# Altium schematic sheet 1_Power.SchDoc
size 419 x 256 mm; SheetNumber: 3; SheetTotal: 4
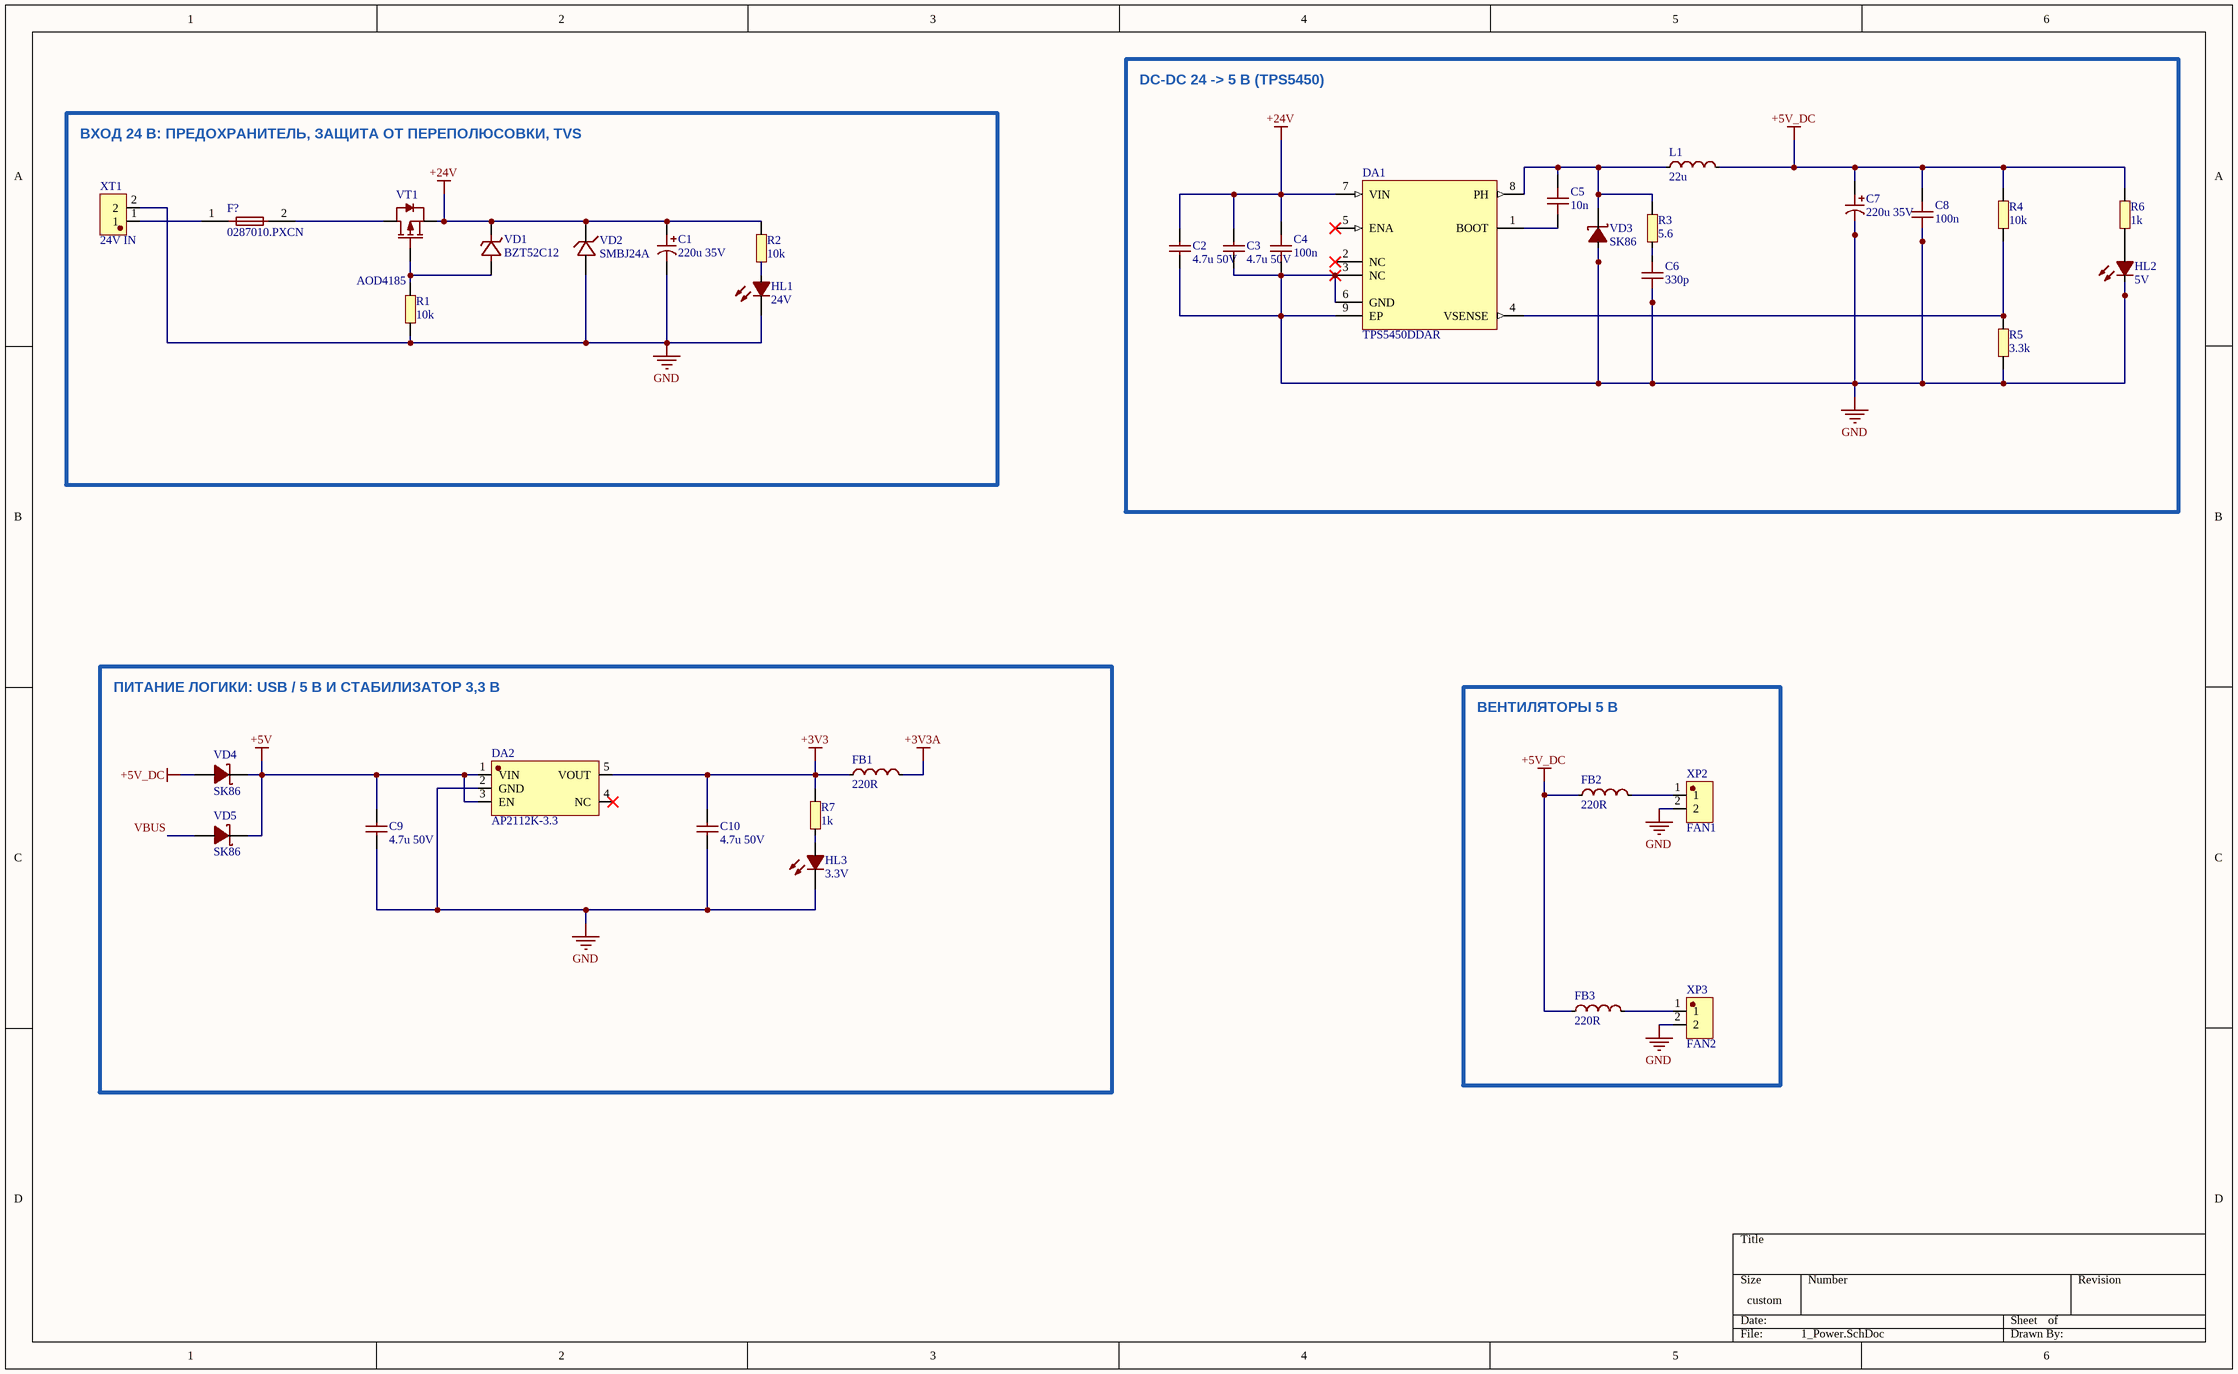
[diagram p0: 1_Power.SchDoc]

## Parts
C1  220u 35V  [CAP-TH_BD8.0-P3.50-D0.5-FD]
C2  4.7u 50V  [C1206]
C3  4.7u 50V  [C1206]
C4  100n  [C0603]
C5  10n  [C0603]
C6  330p  [C0603]
C7  220u 35V  [CAP-TH_BD8.0-P3.50-D0.5-FD]
C8  100n  [C0603]
C9  4.7u 50V  [C1206]
C10  4.7u 50V  [C1206]
DA1  TPS5450DDAR  [SOP-8_L4.9-W3.9-P1.27-LS6.0-BL-EP]
DA2  AP2112K-3.3  [SOT-25-5_L2.9-W1.6-P0.95-LS2.8-BL]
F?  0287010.PXCN  [FUSE-TH_L19.1-W5.1]
FB1  220R  [L0805]
FB2  220R  [L0805]
FB3  220R  [L0805]
HL1  24V  [LED0603-RD_GREEN]
HL2  5V  [LED0603-RD_GREEN]
HL3  3.3V  [LED0603-RD_GREEN]
L1  22u  [IND-SMD_L8.0-W8.0]
R1  10k  [R0603]
R2  10k  [R0603]
R3  5.6  [R0603]
R4  10k  [R0603]
R5  3.3k  [R0603]
R6  1k  [R0603]
R7  1k  [R0603]
VD1  BZT52C12  [SOD-123_L2.7-W1.6-LS3.7-RD-1]
VD2  SMBJ24A  [SMB_L4.3-W3.6-LS5.4-RD]
VD3  SK86  [SMC_L7.1-W6.2-LS8.1-R-RD]
VD4  SK86  [SMC_L7.1-W6.2-LS8.1-R-RD]
VD5  SK86  [SMC_L7.1-W6.2-LS8.1-R-RD]
VT1  AOD4185  [TO-252-3_L6.5-W5.8-P4.58-BL]
XP2  FAN1  [HDR-TH_2P-P2.54-V-M]
XP3  FAN2  [HDR-TH_2P-P2.54-V-M]
XT1  24V IN  [CONN-TH_P3.50_KF350-3.5-2P]

## Blocks framed on the sheet
DC-DC 24 -> 5 В (TPS5450): C2-C8 DA1 HL2 L1 R3-R6 VD3
ВХОД 24 В: ПРЕДОХРАНИТЕЛЬ, ЗАЩИТА ОТ ПЕРЕПОЛЮСОВКИ, TVS: C1 F? HL1 R1 R2 VD1 VD2 VT1 XT1
ПИТАНИЕ ЛОГИКИ: USB / 5 В И СТАБИЛИЗАТОР 3,3 В: C9 C10 DA2 FB1 HL3 R7 VD4 VD5
ВЕНТИЛЯТОРЫ 5 В: FB2 FB3 XP2 XP3

## Nets
+3V3: C10.1 DA2.5(VOUT) FB1.1 R7.1
+3V3A: FB1.2
+5V: C9.1 DA2.1(VIN) DA2.3(EN) VD4.2(K) VD5.2(K)
+5V_DC: C7.1 C8.1 FB2.1 FB3.1 L1.2 R4.1 R6.1 VD4.1(A)
+24V: C1.1 C2.1 C3.1 C4.1 DA1.7(VIN) R2.1 VD1.1(C) VD2.1 VT1.3(S)
GND: C1.2 C2.2 C3.2 C4.2 C6.2 C7.2 C8.2 C9.2 C10.2 DA1.3(NC) DA1.6(GND) DA1.9(EP) DA2.2(GND) HL1.1(C) HL2.1(C) HL3.1(C) R1.2 R5.2 VD2.2 VD3.1(A) XP2.2 XP3.2 XT1.2
VBUS: VD5.1(A)
NetC5_1: C5.1 DA1.8(PH) L1.1 R3.1 VD3.2(K)
NetC5_2: C5.2 DA1.1(BOOT)
NetC6_1: C6.1 R3.2
NetDA1_4: DA1.4(VSENSE) R4.2 R5.1
NetF?_1: F?.1 XT1.1
NetF?_2: F?.2 VT1.2(D)
NetFB2_2: FB2.2 XP2.1
NetFB3_2: FB3.2 XP3.1
NetHL1_2: HL1.2(A) R2.2
NetHL2_2: HL2.2(A) R6.2
NetHL3_2: HL3.2(A) R7.2
NetR1_1: R1.1 VD1.2(A) VT1.1(G)

Not connected (* = marked no-connect by the designer): DA1 2(NC)* 5(ENA)*; DA2 4(NC)*

## Library data of the parts
C1 C7 = 220UF35V8X12KM: Manufacturer: Econd; Value: 220uF; Manufacturer Part Number: 220uF35V8x12KM; LCSC Part: C49304872; Supplier: LCSC; Supplier Part Number: C49304872; JLCPCB Part Class: Extended Part; Datasheet: https://www.lcsc.com/datasheet/C49304872.pdf; Source: JLCEDA/EasyEDA Official Library (https://easyeda.com, https://lceda.cn)
C2 C3 C9 C10 = CL31B475KBHNNNE: 4.7uF (475) ±10% 50V; Manufacturer: SAMSUNG; Value: 4.7uF; Manufacturer Part Number: CL31B475KBHNNNE; LCSC Part: C51205; Supplier: LCSC; Supplier Part Number: C51205; JLCPCB Part Class: Extended Part; Datasheet: https://www.lcsc.com/datasheet/C51205.pdf; LCSC URL: https://lcsc.com/product-detail/Multilayer-Ceramic-Capacitors-MLCC-SMD-SMT_SAMSUNG_CL31B475KBHNNNE_4-7uF-475-10-50V_C51205.html; Source: JLCEDA/EasyEDA Official Library (https://easyeda.com, https://lceda.cn)
C4-C6 C8 = CL10B104KB8NNNC/0603: Manufacturer Part Number: CL10B104KB8NNNC/0603; LCSC Part: C9900007620; Supplier: LCSC; Supplier Part Number: C9900007620; Datasheet: https://www.lcsc.com/datasheet/C9900007620.pdf; Source: JLCEDA/EasyEDA Official Library (https://easyeda.com, https://lceda.cn)
DA1 = TPS5450DDAR: Manufacturer: TI; Manufacturer Part Number: TPS5450DDAR; LCSC Part: C114425; Supplier: LCSC; Supplier Part Number: C114425; JLCPCB Part Class: Extended Part; Datasheet: https://www.lcsc.com/datasheet/C114425.pdf; LCSC URL: https://lcsc.com/product-detail/DC-DC-Converters_TI_TPS5450DDAR_TPS5450DDAR_C114425.html; Source: JLCEDA/EasyEDA Official Library (https://easyeda.com, https://lceda.cn)
DA2 = AP2112K-3.3TRG1: Manufacturer: DIODES; Manufacturer Part Number: AP2112K-3.3TRG1; LCSC Part: C51118; Supplier: LCSC; Supplier Part Number: C51118; JLCPCB Part Class: Extended Part; Datasheet: https://www.lcsc.com/datasheet/C51118.pdf; LCSC URL: https://lcsc.com/product-detail/Low-Dropout-Regulators-LDO_DIODES_AP2112K-3-3TRG1_AP2112K-3-3TRG1_C51118.html; Source: JLCEDA/EasyEDA Official Library (https://easyeda.com, https://lceda.cn)
F? = 0287010.PXCN: Manufacturer: Littelfuse; Manufacturer Part Number: 0287010.PXCN; LCSC Part: C142683; Supplier: LCSC; Supplier Part Number: C142683; JLCPCB Part Class: Extended Part; Datasheet: https://www.lcsc.com/datasheet/C142683.pdf; Source: JLCEDA/EasyEDA Official Library (https://easyeda.com, https://lceda.cn)
FB1-FB3 = BLM21PG221SN1D: 220Ohm ±25% @100MHz 2A; Manufacturer: muRata; Value: 220Ω; Manufacturer Part Number: BLM21PG221SN1D; LCSC Part: C85840; Supplier: LCSC; Supplier Part Number: C85840; JLCPCB Part Class: Extended Part; Datasheet: https://www.lcsc.com/datasheet/C85840.pdf; LCSC URL: https://lcsc.com/product-detail/Ferrite-Beads-And-Chips_muRata_BLM21PG221SN1D_220R-25-at100MHz-2A_C85840.html; Source: JLCEDA/EasyEDA Official Library (https://easyeda.com, https://lceda.cn)
HL1-HL3 = KT-0603GH: Manufacturer Part Number: KT-0603GH; LCSC Part: C9900005170; Supplier: LCSC; Supplier Part Number: C9900005170; JLCPCB Part Class: Extended Part; Datasheet: https://www.lcsc.com/datasheet/C9900005170.pdf; Source: JLCEDA/EasyEDA Official Library (https://easyeda.com, https://lceda.cn)
L1 = SWPA8040S220MT: 22uH ±20%; Manufacturer: Sunlord; Value: 22uH; Manufacturer Part Number: SWPA8040S220MT; LCSC Part: C15857; Supplier: LCSC; Supplier Part Number: C15857; JLCPCB Part Class: Extended Part; Datasheet: https://www.lcsc.com/datasheet/C15857.pdf; LCSC URL: https://lcsc.com/product-detail/Power-Inductors_22uH-20_C15857.html; Source: JLCEDA/EasyEDA Official Library (https://easyeda.com, https://lceda.cn)
R1-R7 = 0603WAF1002T5E: 10KOhm (1002) ±1%; Manufacturer: UNI-ROYAL; Value: 10kΩ; Manufacturer Part Number: 0603WAF1002T5E; LCSC Part: C25804; Supplier: LCSC; Supplier Part Number: C25804; JLCPCB Part Class: Basic Part; Datasheet: https://www.lcsc.com/datasheet/C25804.pdf; LCSC URL: https://lcsc.com/product-detail/Chip-Resistor-Surface-Mount-UniOhm_10KR-1002-1_C25804.html; Source: JLCEDA/EasyEDA Official Library (https://easyeda.com, https://lceda.cn)
VD1 = BZT52C12V: Manufacturer: JUXING; Manufacturer Part Number: BZT52C12V; LCSC Part: C5182293; Supplier: LCSC; Supplier Part Number: C5182293; JLCPCB Part Class: Extended Part; Datasheet: https://www.lcsc.com/datasheet/C5182293.pdf; Source: JLCEDA/EasyEDA Official Library (https://easyeda.com, https://lceda.cn)
VD2 = SMBJ24A_C224017: Manufacturer: Littelfuse; Manufacturer Part Number: SMBJ24A; LCSC Part: C224017; Supplier: LCSC; Supplier Part Number: C224017; JLCPCB Part Class: Extended Part; Datasheet: https://www.lcsc.com/datasheet/C224017.pdf; LCSC URL: https://lcsc.com/product-detail/Others_Littelfuse_SMBJ24A_Littelfuse-SMBJ24A_C224017.html; Source: JLCEDA/EasyEDA Official Library (https://easyeda.com, https://lceda.cn)
VD3-VD5 = SK86: Manufacturer: MDD; Manufacturer Part Number: SK86C; LCSC Part: C64338; Supplier: LCSC; Supplier Part Number: C64338; JLCPCB Part Class: Extended Part; Datasheet: https://www.lcsc.com/datasheet/C64338.pdf; LCSC URL: https://lcsc.com/product-detail/Schottky-Barrier-Diodes-SBD_SK86_C64338.html; Source: JLCEDA/EasyEDA Official Library (https://easyeda.com, https://lceda.cn)
VT1 = AOD4185: Manufacturer: AOS; Manufacturer Part Number: AOD4185L; LCSC Part: C77993; Supplier: LCSC; Supplier Part Number: C77993; JLCPCB Part Class: Extended Part; Datasheet: https://www.lcsc.com/datasheet/C77993.pdf; LCSC URL: https://lcsc.com/product-detail/MOSFET_AOS_AOD4185_AOD4185_C77993.html; Source: JLCEDA/EasyEDA Official Library (https://easyeda.com, https://lceda.cn)
XP2 XP3 = PZ254V-11-02P: Manufacturer: XFCN; Manufacturer Part Number: PZ254V-11-02P; LCSC Part: C492401; Supplier: LCSC; Supplier Part Number: C492401; JLCPCB Part Class: Extended Part; Datasheet: https://www.lcsc.com/datasheet/C492401.pdf; LCSC URL: https://lcsc.com/product-detail/New-Arrivals_XFCN-PZ254V-11-02P_C492401.html; Source: JLCEDA/EasyEDA Official Library (https://easyeda.com, https://lceda.cn)
XT1 = KF350-3.5-2P: Manufacturer: KEFA; Manufacturer Part Number: KF350-3.5-2P; LCSC Part: C474892; Supplier: LCSC; Supplier Part Number: C474892; JLCPCB Part Class: Extended Part; Datasheet: https://www.lcsc.com/datasheet/C474892.pdf; LCSC URL: https://lcsc.com/product-detail/New-Quadratic-Unclassified-Data_Cixi-Kefa-Elec-KF350-3-5-2P_C474892.html; Source: JLCEDA/EasyEDA Official Library (https://easyeda.com, https://lceda.cn)